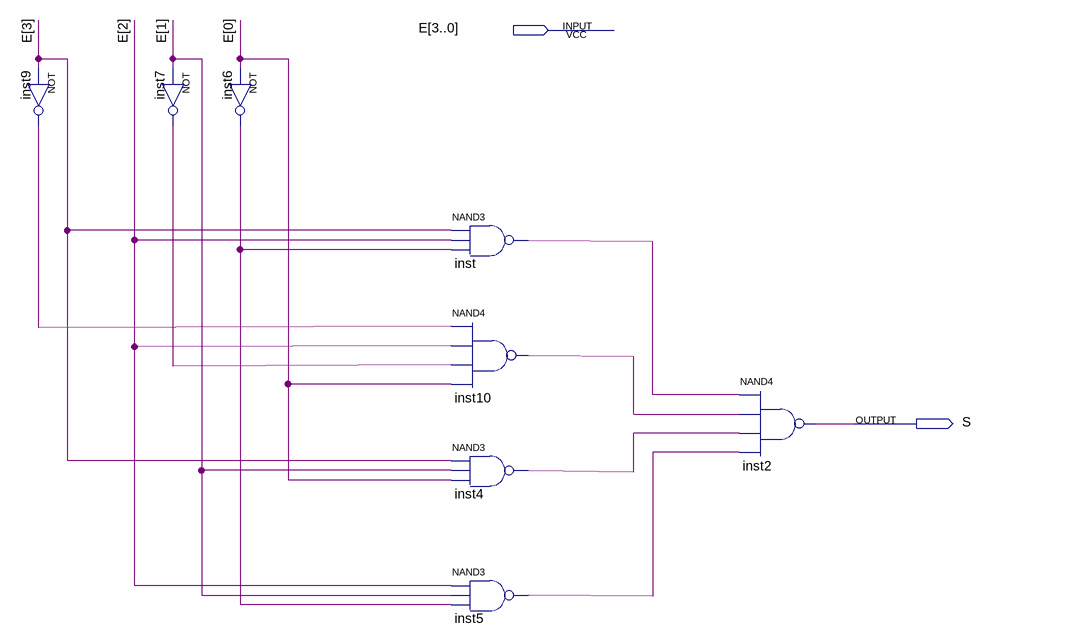
[diagram p0: schematic sheet]
// Quartus schematic S_B.bdf as structural Verilog: 8 symbols, 2 pins
module S_B (
  input  [3:0] E,
  output S
);

  wire inst4_out, inst5_out, inst6_out, inst7_out, inst9_out, inst10_out, inst_out;

  not inst9 (inst9_out, E[3]);
  not inst6 (inst6_out, E[0]);
  not inst7 (inst7_out, E[1]);
  nand inst (inst_out, E[3], E[2], inst6_out);
  nand inst10 (inst10_out, inst9_out, E[2], inst7_out, E[0]);
  nand inst4 (inst4_out, E[3], E[1], E[0]);
  nand inst5 (inst5_out, E[2], E[1], inst6_out);
  nand inst2 (S, inst_out, inst10_out, inst4_out, inst5_out);
endmodule
